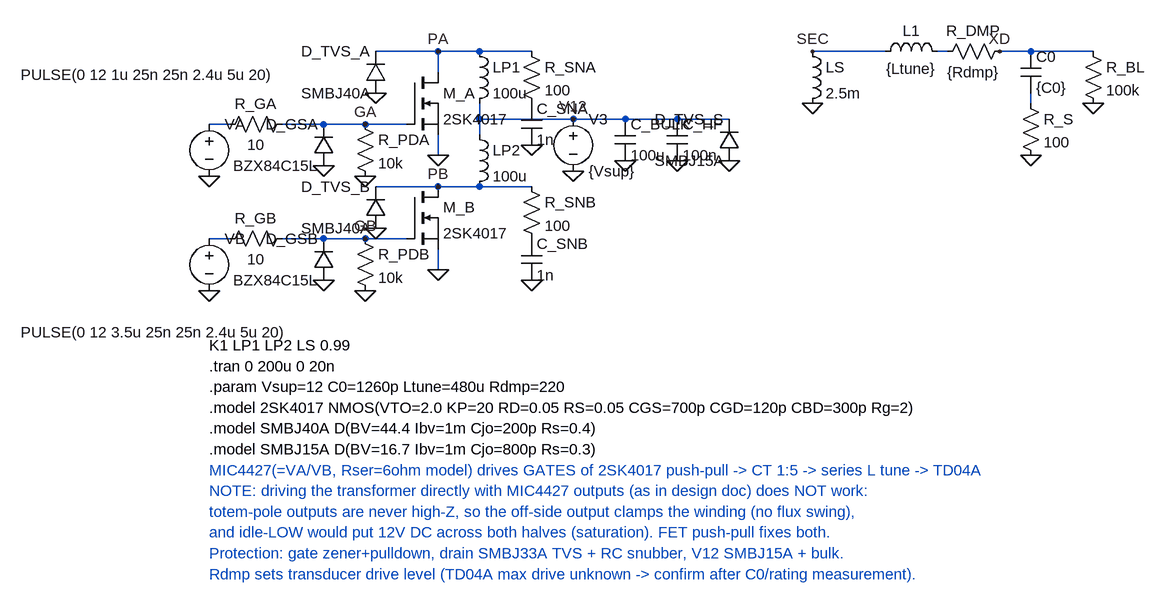
[diagram p0: schematic TX_advanced.asc]
TX_advanced.asc, the LTspice schematic file:
Version 4.1
SHEET 1 1600 900
WIRE -384 80 -352 80
WIRE -272 80 -208 80
WIRE -208 80 -144 80
WIRE -144 80 -80 80
WIRE -32 0 -32 -32
WIRE -128 -32 -32 -32
WIRE -32 -32 32 -32
WIRE 32 -32 112 -32
WIRE -32 96 -32 128
WIRE -384 256 -352 256
WIRE -272 256 -208 256
WIRE -208 256 -144 256
WIRE -144 256 -80 256
WIRE -32 176 32 176
WIRE -128 176 -32 176
WIRE 32 176 112 176
WIRE -32 272 -32 304
WIRE 32 48 32 72
WIRE 32 72 32 96
WIRE 32 72 176 72
WIRE 176 72 256 72
WIRE 256 72 336 72
WIRE 336 72 416 72
WIRE 880 32 880 48
WIRE 544 -32 656 -32
WIRE 736 -32 752 -32
WIRE 832 -32 880 -32
WIRE 880 -32 976 -32
FLAG -384 160 0
FLAG -384 336 0
FLAG -208 144 0
FLAG -208 320 0
FLAG -144 160 0
FLAG -144 336 0
FLAG -32 128 0
FLAG -32 304 0
FLAG -128 32 0
FLAG -128 240 0
FLAG 112 112 0
FLAG 112 320 0
FLAG 176 152 0
FLAG 256 136 0
FLAG 336 136 0
FLAG 416 136 0
FLAG 544 48 0
FLAG 880 128 0
FLAG 976 48 0
FLAG -144 80 GA
FLAG -144 256 GB
FLAG -32 -32 PA
FLAG -32 176 PB
FLAG 176 72 V12
FLAG 544 -32 SEC
FLAG 832 -32 XD
SYMBOL voltage -384 64 R0
WINDOW 3 -290 -60 Left 2
SYMATTR InstName VA
SYMATTR Value PULSE(0 12 1u 25n 25n 2.4u 5u 20)
SYMATTR SpiceLine Rser=6
SYMBOL voltage -384 240 R0
WINDOW 3 -290 160 Left 2
SYMATTR InstName VB
SYMATTR Value PULSE(0 12 3.5u 25n 25n 2.4u 5u 20)
SYMATTR SpiceLine Rser=6
SYMBOL res -256 64 R90
WINDOW 0 0 56 VBottom 2
WINDOW 3 32 56 VTop 2
SYMATTR InstName R_GA
SYMATTR Value 10
SYMBOL res -256 240 R90
WINDOW 0 0 56 VBottom 2
WINDOW 3 32 56 VTop 2
SYMATTR InstName R_GB
SYMATTR Value 10
SYMBOL diode -192 144 R180
WINDOW 0 24 64 Left 2
WINDOW 3 24 0 Left 2
SYMATTR InstName D_GSA
SYMATTR Value BZX84C15L
SYMBOL diode -192 320 R180
WINDOW 0 24 64 Left 2
WINDOW 3 24 0 Left 2
SYMATTR InstName D_GSB
SYMATTR Value BZX84C15L
SYMBOL res -160 64 R0
SYMATTR InstName R_PDA
SYMATTR Value 10k
SYMBOL res -160 240 R0
SYMATTR InstName R_PDB
SYMATTR Value 10k
SYMBOL nmos -80 0 R0
SYMATTR InstName M_A
SYMATTR Value 2SK4017
SYMBOL nmos -80 176 R0
SYMATTR InstName M_B
SYMATTR Value 2SK4017
SYMBOL diode -112 32 R180
WINDOW 0 24 64 Left 2
WINDOW 3 24 0 Left 2
SYMATTR InstName D_TVS_A
SYMATTR Value SMBJ40A
SYMBOL diode -112 240 R180
WINDOW 0 24 64 Left 2
WINDOW 3 24 0 Left 2
SYMATTR InstName D_TVS_B
SYMATTR Value SMBJ40A
SYMBOL ind 16 -48 R0
SYMATTR InstName LP1
SYMATTR Value 100u
SYMATTR SpiceLine Rser=0.1
SYMBOL ind 16 80 R0
SYMATTR InstName LP2
SYMATTR Value 100u
SYMATTR SpiceLine Rser=0.1
SYMBOL res 96 -48 R0
SYMATTR InstName R_SNA
SYMATTR Value 100
SYMBOL cap 96 48 R0
SYMATTR InstName C_SNA
SYMATTR Value 1n
SYMBOL res 96 160 R0
SYMATTR InstName R_SNB
SYMATTR Value 100
SYMBOL cap 96 256 R0
SYMATTR InstName C_SNB
SYMATTR Value 1n
SYMBOL voltage 176 56 R0
SYMATTR InstName V3
SYMATTR Value {Vsup}
SYMBOL cap 240 72 R0
SYMATTR InstName C_BULK
SYMATTR Value 100u
SYMBOL cap 320 72 R0
SYMATTR InstName C_HF
SYMATTR Value 100n
SYMBOL diode 432 136 R180
WINDOW 0 24 64 Left 2
WINDOW 3 24 0 Left 2
SYMATTR InstName D_TVS_S
SYMATTR Value SMBJ15A
SYMBOL ind 528 -48 R0
SYMATTR InstName LS
SYMATTR Value 2.5m
SYMATTR SpiceLine Rser=2
SYMBOL ind 640 -16 R270
WINDOW 0 32 56 VTop 2
WINDOW 3 5 56 VBottom 2
SYMATTR InstName L1
SYMATTR Value {Ltune}
SYMATTR SpiceLine Rser=3
SYMBOL res 848 -48 R90
WINDOW 0 0 56 VBottom 2
WINDOW 3 32 56 VTop 2
SYMATTR InstName R_DMP
SYMATTR Value {Rdmp}
SYMBOL cap 864 -32 R0
SYMATTR InstName C0
SYMATTR Value {C0}
SYMBOL res 864 32 R0
SYMATTR InstName R_S
SYMATTR Value 100
SYMBOL res 960 -48 R0
SYMATTR InstName R_BL
SYMATTR Value 100k
TEXT -384 420 Left 2 !K1 LP1 LP2 LS 0.99
TEXT -384 452 Left 2 !.tran 0 200u 0 20n
TEXT -384 484 Left 2 !.param Vsup=12 C0=1260p Ltune=480u Rdmp=220
TEXT -384 516 Left 2 !.model 2SK4017 NMOS(VTO=2.0 KP=20 RD=0.05 RS=0.05 CGS=700p CGD=120p CBD=300p Rg=2)
TEXT -384 548 Left 2 !.model SMBJ40A D(BV=44.4 Ibv=1m Cjo=200p Rs=0.4)
TEXT -384 580 Left 2 !.model SMBJ15A D(BV=16.7 Ibv=1m Cjo=800p Rs=0.3)
TEXT -384 612 Left 2 ;MIC4427(=VA/VB, Rser=6ohm model) drives GATES of 2SK4017 push-pull -> CT 1:5 -> series L tune -> TD04A
TEXT -384 644 Left 2 ;NOTE: driving the transformer directly with MIC4427 outputs (as in design doc) does NOT work:
TEXT -384 676 Left 2 ;totem-pole outputs are never high-Z, so the off-side output clamps the winding (no flux swing),
TEXT -384 708 Left 2 ;and idle-LOW would put 12V DC across both halves (saturation). FET push-pull fixes both.
TEXT -384 740 Left 2 ;Protection: gate zener+pulldown, drain SMBJ33A TVS + RC snubber, V12 SMBJ15A + bulk.
TEXT -384 772 Left 2 ;Rdmp sets transducer drive level (TD04A max drive unknown -> confirm after C0/rating measurement).

The netlist it stands for:
* TX_advanced.asc
VA N001 0 PULSE(0 12 1u 25n 25n 2.4u 5u 20) Rser=6
VB N002 0 PULSE(0 12 3.5u 25n 25n 2.4u 5u 20) Rser=6
R_GA GA N001 10
R_GB GB N002 10
D_GSA 0 GA BZX84C15L
D_GSB 0 GB BZX84C15L
R_PDA GA 0 10k
R_PDB GB 0 10k
M_A PA GA 0 0 2SK4017
M_B PB GB 0 0 2SK4017
D_TVS_A 0 PA SMBJ40A
D_TVS_B 0 PB SMBJ40A
LP1 PA V12 100u Rser=0.1
LP2 V12 PB 100u Rser=0.1
R_SNA PA P001 100
C_SNA P001 0 1n
R_SNB PB P002 100
C_SNB P002 0 1n
V3 V12 0 {Vsup}
C_BULK V12 0 100u
C_HF V12 0 100n
D_TVS_S 0 V12 SMBJ15A
LS SEC 0 2.5m Rser=2
L1 SEC N004 {Ltune} Rser=3
R_DMP XD N004 {Rdmp}
C0 XD N003 {C0}
R_S N003 0 100
R_BL XD 0 100k
.model D D
.lib standard.dio
.model NMOS NMOS
.model PMOS PMOS
.lib standard.mos
K1 LP1 LP2 LS 0.99
.tran 0 200u 0 20n
.param Vsup=12 C0=1260p Ltune=480u Rdmp=220
.model 2SK4017 NMOS(VTO=2.0 KP=20 RD=0.05 RS=0.05 CGS=700p CGD=120p CBD=300p Rg=2)
.model SMBJ40A D(BV=44.4 Ibv=1m Cjo=200p Rs=0.4)
.model SMBJ15A D(BV=16.7 Ibv=1m Cjo=800p Rs=0.3)
* MIC4427(=VA/VB, Rser=6ohm model) drives GATES of 2SK4017 push-pull -> CT 1:5 -> series L tune -> TD04A
* NOTE: driving the transformer directly with MIC4427 outputs (as in design doc) does NOT work:
* totem-pole outputs are never high-Z, so the off-side output clamps the winding (no flux swing),
* and idle-LOW would put 12V DC across both halves (saturation). FET push-pull fixes both.
* Protection: gate zener+pulldown, drain SMBJ33A TVS + RC snubber, V12 SMBJ15A + bulk.
* Rdmp sets transducer drive level (TD04A max drive unknown -> confirm after C0/rating measurement).
.backanno
.end